# EasyEDA Pro project NAI-Redd PCB.epro

# Schematic Schematic2
Board Name: PCB2; Create Date: 2026-11-11; Page Name: P1; Project Name: NAI-Lucifer PCB; Schematic Name: Schematic2; Update Date: 2026-11-11; Company: EasyEDA.com; Page Size: A4; Version: V1.0
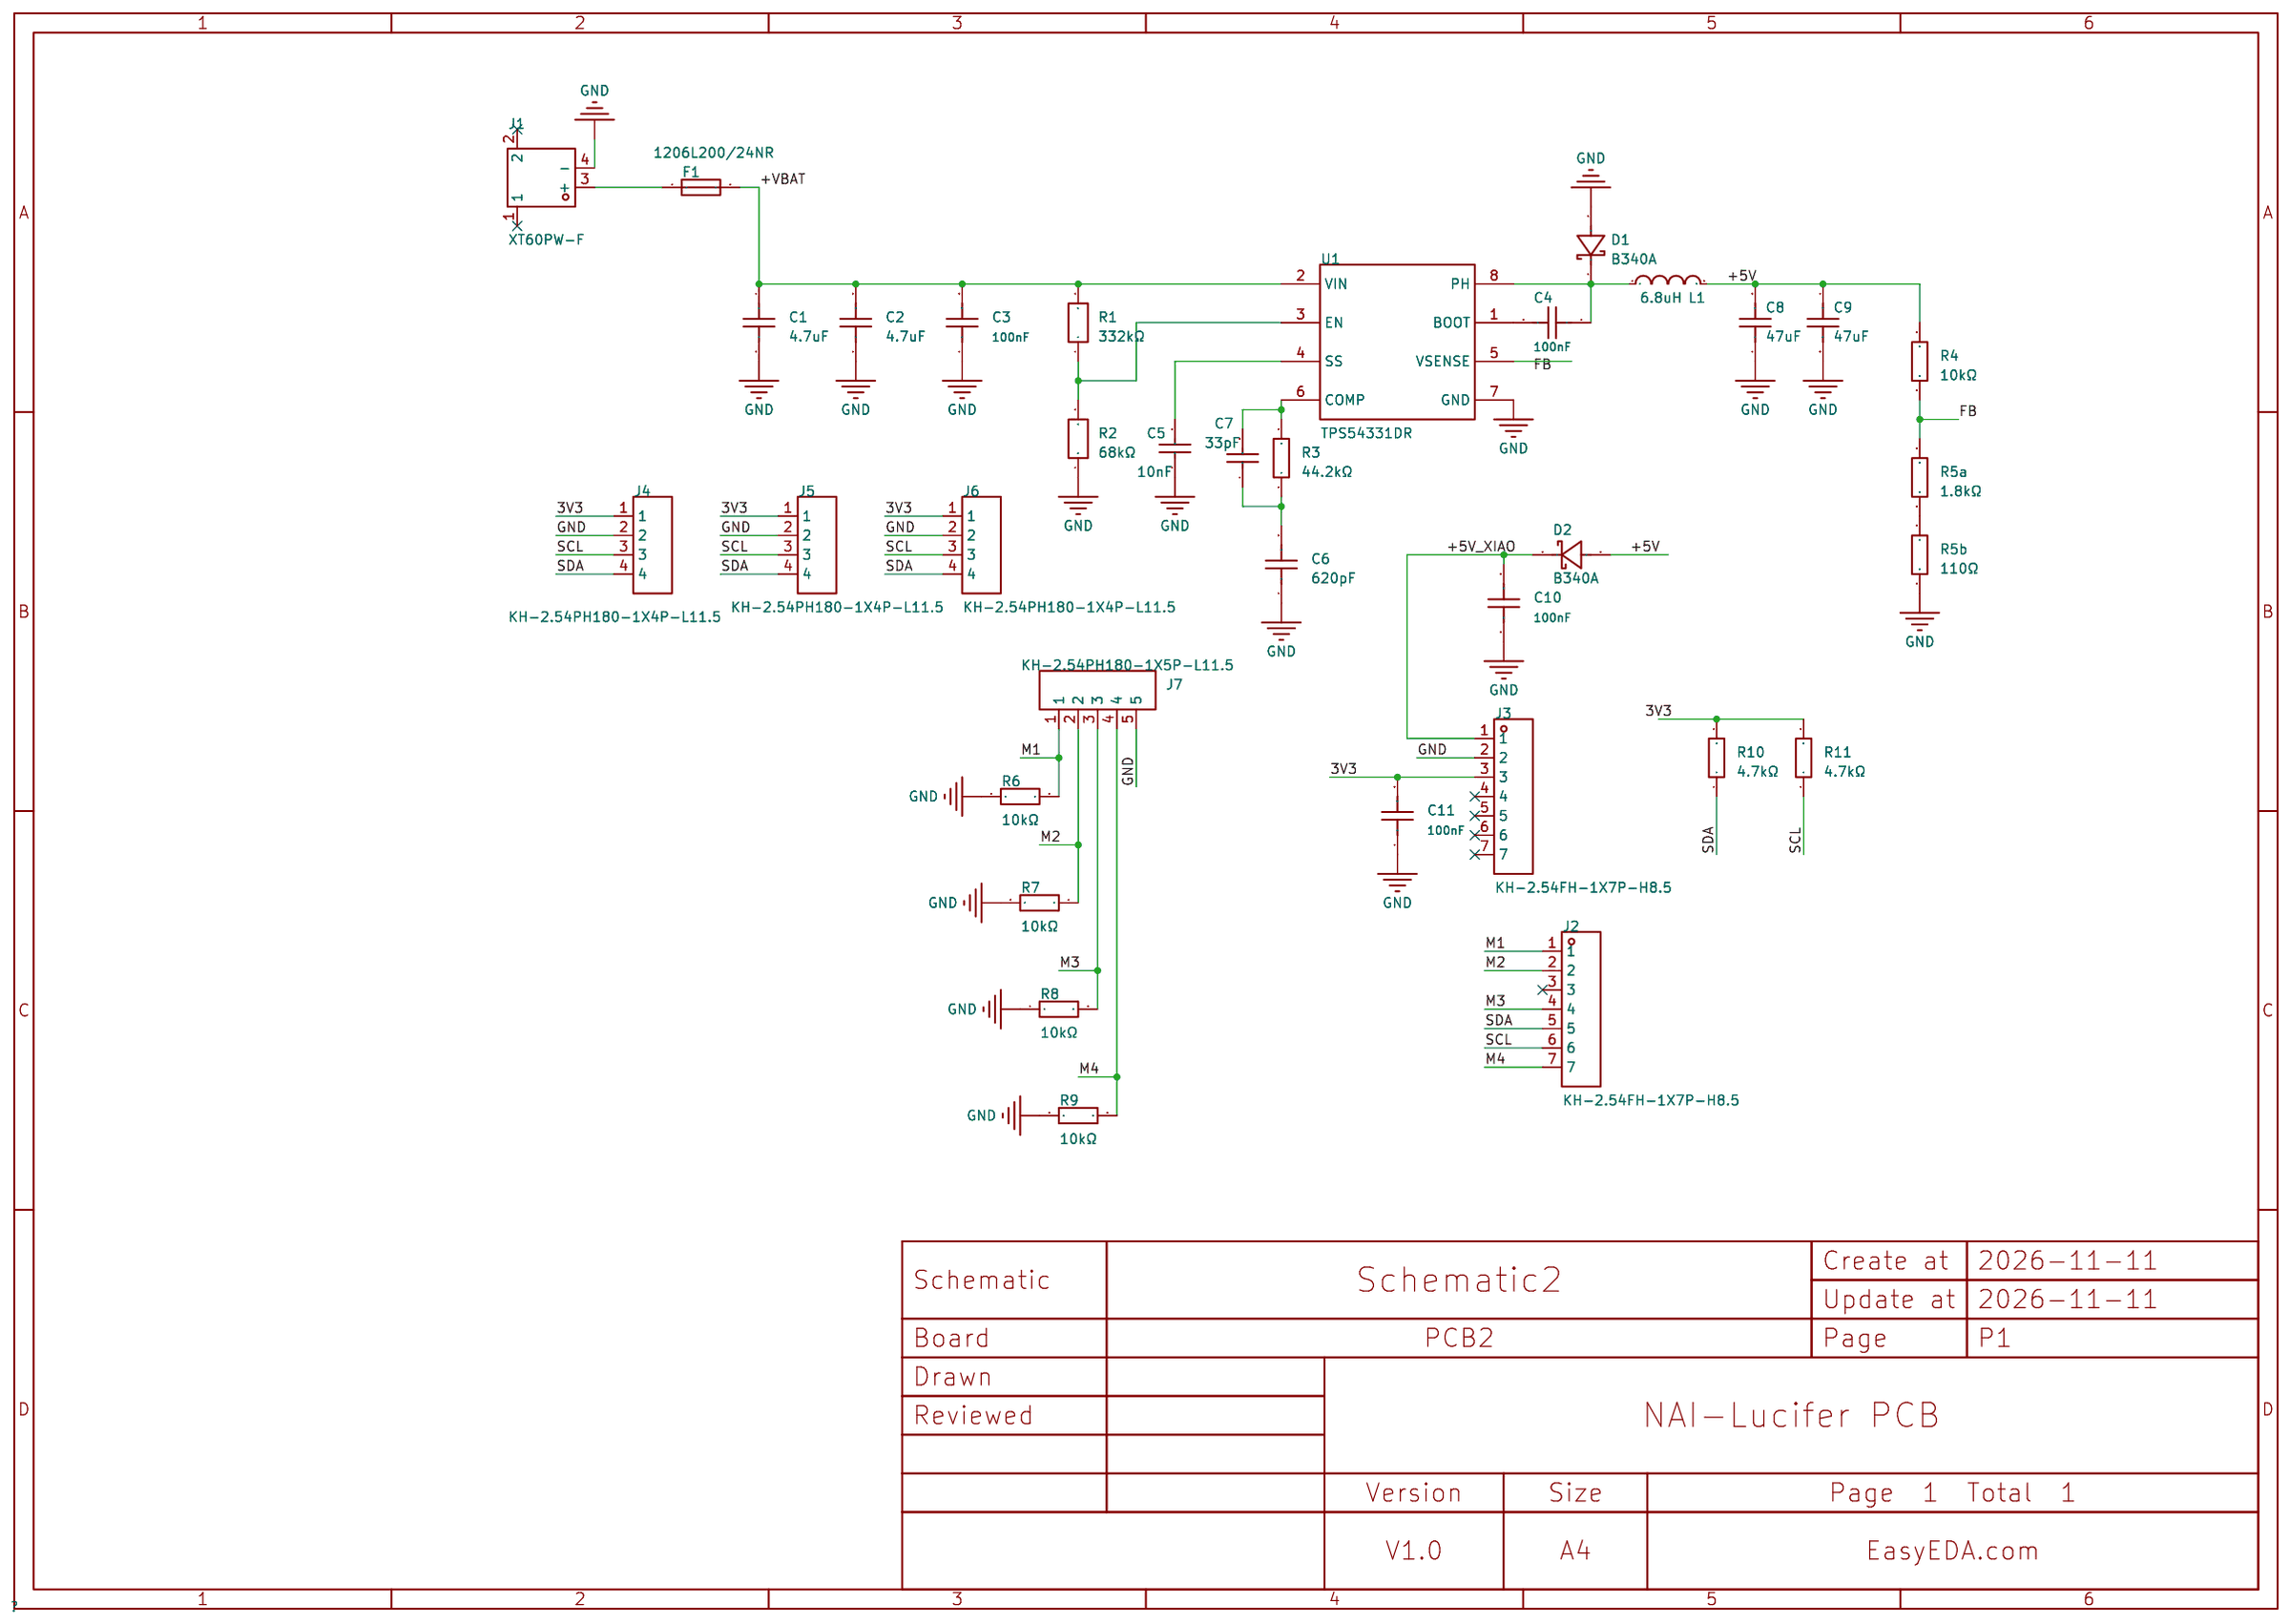
[diagram p0: schematic sheet]

## Parts
C1  4.7uF  [C1210]
C2  4.7uF  [C1210]
C3  100nF  [C0603]
C4  100nF  [C0603]
C5  10nF  [C0603]
C6  620pF  [C0603]
C7  33pF  [C0603]
C8  47uF  [C1206]
C9  47uF  [C1206]
C10  100nF  [C0603]
C11  100nF  [C0603]
D1  B340A  [SMA_L4.3-W2.6-LS5.0-RD]
D2  B340A  [SMA_L4.3-W2.6-LS5.0-RD]
F1  1206L200/24NR  [F1206]
J1  XT60PW-F  [TH_2P-XT60PW-F]
J2  KH-2.54FH-1X7P-H8.5  [HDR-TH_7P-P2.54-V-F]
J3  KH-2.54FH-1X7P-H8.5  [HDR-TH_7P-P2.54-V-F]
J4  KH-2.54PH180-1X4P-L11.5  [HDR-TH_4P-P2.54-V-M]
J5  KH-2.54PH180-1X4P-L11.5  [HDR-TH_4P-P2.54-V-M]
J6  KH-2.54PH180-1X4P-L11.5  [HDR-TH_4P-P2.54-V-M]
J7  KH-2.54PH180-1X5P-L11.5  [HDR-TH_5P-P2.54-V-M]
L1  6.8uH  [IND-SMD_L7.0-W6.6]
R1  332kΩ  [R0603]
R2  68kΩ  [R0603]
R3  44.2kΩ  [R0603]
R4  10kΩ  [R0603]
R5a  1.8kΩ  [R0603]
R5b  110Ω  [R0603]
R6  10kΩ  [R0603]
R7  10kΩ  [R0603]
R8  10kΩ  [R0603]
R9  10kΩ  [R0603]
R10  4.7kΩ  [R0603]
R11  4.7kΩ  [R0603]
U1  TPS54331DR  [SOIC-8_L5.0-W4.0-P1.27-LS6.0-BL]

## Library data of the parts
C1 C2 = C1210C475K5RACTU: Capacitance:4.7uF Tolerance:±10% Tolerance:±10% Voltage Rating:50V Temperature Coefficient:X7R; LCSC Part Name: 4.7uF ±10% 50V; Supplier Part: C2182224; Manufacturer: KEMET(基美); Supplier Footprint: 1210; JLCPCB Part Class: Extended Part; Datasheet: https://item.szlcsc.com/datasheet/C1210C475K5RACTU/2274291.html; Supplier: LCSC; Tolerance: ±10%; Voltage Rating: 50V; Temperature Coefficient: X7R; Check: true
C3 C4 C10 C11 = CC0603KRX7R9BB104: Capacitance:100nF Tolerance:±10% Tolerance:±10% Voltage Rating:50V Temperature Coefficient:X7R; LCSC Part Name: 100nF ±10% 50V; Supplier Part: C14663; Manufacturer: YAGEO(国巨); Supplier Footprint: 0603; JLCPCB Part Class: Basic Part; Datasheet: https://item.szlcsc.com/datasheet/CC0603KRX7R9BB104/15331.html; Supplier: LCSC; Tolerance: ±10%; Voltage Rating: 50V; Temperature Coefficient: X7R; Check: true
C5 = CL10B103KB8NNNC: Capacitance:10nF Tolerance:±10% Tolerance:±10% Voltage Rating:50V Temperature Coefficient:X7R; LCSC Part Name: 10nF ±10% 50V; Supplier Part: C1589; Manufacturer: SAMSUNG(三星); Supplier Footprint: 0603; JLCPCB Part Class: Extended Part; Datasheet: https://item.szlcsc.com/datasheet/CL10B103KB8NNNC/1941.html; Supplier: LCSC; Tolerance: ±10%; Voltage Rating: 50V; Temperature Coefficient: X7R; Check: true
C6 = GRM1885C1H621JA01D: Capacitance: Tolerance:±5% Tolerance:±5% Voltage Rated: Temperature Coefficient:; LCSC Part Name: 620pF ±5% 50V; Supplier Part: C527998; Manufacturer: muRata(村田); Supplier Footprint: 0603; JLCPCB Part Class: Extended Part; Datasheet: https://atta.szlcsc.com/upload/public/pdf/source/20200407/C503309_0211D99E6F86B2657E389DD3F8367252.pdf; Supplier: LCSC; Tolerance: ±5%; Check: true
C7 = CL10C330JB8NNNC: Capacitance:33pF Tolerance:±5% Tolerance:±5% Voltage Rating:50V Temperature Coefficient:C0G; LCSC Part Name: 33pF ±5% 50V; Supplier Part: C1663; Manufacturer: SAMSUNG(三星); Supplier Footprint: 0603; JLCPCB Part Class: Basic Part; Datasheet: https://item.szlcsc.com/datasheet/CL10C330JB8NNNC/2015.html; Supplier: LCSC; Tolerance: ±5%; Voltage Rating: 50V; Temperature Coefficient: C0G; Check: true
C8 C9 = CL31A476MPHNNNE: Capacitance:47uF Tolerance:±20% Tolerance:±20% Voltage Rating:10V Temperature Coefficient:X5R; LCSC Part Name: 47uF ±20% 10V; Supplier Part: C96123; Manufacturer: SAMSUNG(三星); Supplier Footprint: 1206; JLCPCB Part Class: Basic Part; Datasheet: https://item.szlcsc.com/datasheet/CL31A476MPHNNNE/97327.html; Supplier: LCSC; Tolerance: ±20%; Voltage Rating: 10V; Temperature Coefficient: X5R; Check: true
D1 D2 = B340A_C3018525: Forward Voltage (Vf@If):550mV@3A Reverse Voltage (Vr):40V Average Rectified Current (Io):3A Reverse Leakage Current (Ir):500uA@40V; LCSC Part Name: 电压:40V 电流:3A; Supplier Part: C3018525; Manufacturer: FUXINSEMI(富芯森美); Supplier Footprint: SMA(DO-214AC); JLCPCB Part Class: Extended Part; Datasheet: https://atta.szlcsc.com/upload/public/pdf/source/20220530/48889337C27311960E6F9D350CFD44EF.pdf; Supplier: LCSC; Forward Voltage (Vf@If): 550mV@3A; Reverse Voltage (Vr): 40V; Average Rectified Current (Io): 3A; Reverse Leakage Current (Ir): 500uA@40V; Check: true
F1 = 1206L200/24NR: Voltage - Max:24V Current - Max:40A Hold Current:2A Trip Current:3.5A Power Dissipation:1.2W Resistance - Initial (Ri) (Min):15mΩ Resistance - Post Trip (R1) (Max):80mΩ Time to Trip(Max):1.5s Operating Temperature:-40℃~+85℃ Operating Temperature:-40℃~+85℃; LCSC Part Name: 24V 2.00A 1206 自恢复; Supplier Part: C42396578; Manufacturer: LUTE(陆特); Supplier Footprint: 1206; JLCPCB Part Class: Extended Part; Datasheet: https://item.szlcsc.com/datasheet/1206L200%252F24NR/44344788.html; Supplier: LCSC; Voltage - Max: 24V; Current - Max: 40A; Hold Current: 2A; Trip Current: 3.5A; Power Dissipation: 1.2W; Resistance - Initial (Ri) (Min): 15mΩ; Resistance - Post Trip (R1) (Max): 80mΩ; Time to Trip(Max): 1.5s; Operating Temperature: -40℃~+85℃; Length: 3.6mm; Width: 1.9mm; Height: 1.6mm; Check: true
J1 = XT60PW-F: colour:Yellow Connector type:Horizontal plug interface form:Female; LCSC Part Name: AMASS(艾迈斯)插头锂电池组充电接头 线到板连接器大电流30A连接器 航模电调卧式焊板 母头XT60PW-F.G.Y; Supplier Part: C428722; Manufacturer: AMASS(艾迈斯); JLCPCB Part Class: Extended Part; Datasheet: https://item.szlcsc.com/datasheet/XT60PW-F/423834.html; Supplier: LCSC; colour: Yellow; Connector type: Horizontal plug; interface form: Female; Check: true
J2 J3 = KH-2.54FH-1X7P-H8.5: Holes Structure:1x7P Pitch:2.54mm Row Spacing:- Circular Hole / Square Hole:Square Hole Mounting Type:Through Hole Number of Rows:1 Number of Positions:7P Current Rating:3A Voltage Rating (Max):- Holes Direction:Top Insulation Height:8.5mm Contact Materia; LCSC Part Name: 1x7P 间距:2.54mm 直插; Supplier Part: C2932672; Manufacturer: kinghelm(金航标); Supplier Footprint: 插件,P=2.54mm; JLCPCB Part Class: Extended Part; Datasheet: https://item.szlcsc.com/datasheet/KH-2.54FH-1X7P-H8.5/3278193.html; Supplier: LCSC; Holes Structure: 1x7P; Pitch: 2.54mm; Circular Hole / Square Hole: Square Hole; Mounting Type: Through Hole; Number of Rows: 1; Number of Positions: 7P; Current Rating: 3A; Holes Direction: Top; Insulation Height: 8.5mm; Contact Material: Brass; Contact Plating: Gold; Operating Temperature: -40℃~+105℃; PIN Length: 3mm; Check: true
J4-J6 = KH-2.54PH180-1X4P-L11.5: Pin Structure:1x4P Pitch:2.54mm Row Spacing:- Circluar Pins/Square Pins:Pin Header Mounting Type:Through Hole Number of Rows:1 Number of Pins:4P Current Rating:3A Voltage Rating (Max):- Length of Mating Pin:6mm Insulation Height:2.5mm Length of End Connec; LCSC Part Name: 1x4P 间距:2.54mm 方针 直插; Supplier Part: C2905435; Manufacturer: kinghelm(金航标); Supplier Footprint: 插件,P=2.54mm; JLCPCB Part Class: Extended Part; Datasheet: https://item.szlcsc.com/datasheet/KH-2.54PH180-1X4P-L11.5/3175223.html; Supplier: LCSC; Pin Structure: 1x4P; Pitch: 2.54mm; Circluar Pins/Square Pins: Pin Header; Mounting Type: Through Hole; Number of Rows: 1; Number of Pins: 4P; Current Rating: 3A; Length of Mating Pin: 6mm; Insulation Height: 2.5mm; Length of End Connection Pin: 3mm; Operating Temperature: -40℃~+105℃; Color: Black; Check: true
J7 = KH-2.54PH180-1X5P-L11.5: Pin Structure:1x5P Pitch:2.54mm Row Spacing:- Circluar Pins/Square Pins:Pin Header Mounting Type:Through Hole Number of Rows:1 Number of Pins:5P Current Rating:3A Voltage Rating (Max):- Length of Mating Pin:6mm Insulation Height:2.5mm Length of End Connec; LCSC Part Name: 1x5P 间距:2.54mm 方针 直插; Supplier Part: C2932699; Manufacturer: kinghelm(金航标); Supplier Footprint: 插件,P=2.54mm; JLCPCB Part Class: Extended Part; Datasheet: https://item.szlcsc.com/datasheet/KH-2.54PH180-1X5P-L11.5/3278220.html; Supplier: LCSC; Pin Structure: 1x5P; Pitch: 2.54mm; Circluar Pins/Square Pins: Pin Header; Mounting Type: Through Hole; Number of Rows: 1; Number of Pins: 5P; Current Rating: 3A; Length of Mating Pin: 6mm; Insulation Height: 2.5mm; Length of End Connection Pin: 3mm; Operating Temperature: -40℃~+105℃; Color: Black; Check: true
L1 = TMPC0624H-6R8MG-D: Inductance: Tolerance:±20% Tolerance:±20% Rated Current: Saturation Current (Isat):7A DC Resistance (DCR):; LCSC Part Name: 6.8uH ±20% 7A; Supplier Part: C357230; Manufacturer: TAI-TECH(台庆); Supplier Footprint: SMD,7x6.6mm; JLCPCB Part Class: Extended Part; Datasheet: https://atta.szlcsc.com/upload/public/pdf/source/20200917/C357230_D0E636AD8F4F6E55E8FC0BE9190F699A.pdf; Supplier: LCSC; Tolerance: ±20%; Saturation Current (Isat): 7A; Check: true
R1 = RMCF0603FT332K: Type:Thick Film Resistor Resistance:332kΩ Tolerance:±1% Tolerance:±1% Power(Watts):100mW Temperature Coefficient:±100ppm/℃ Temperature Coefficient:±100ppm/℃ Operating Temperature:-55℃~+155℃ Operating Temperature:-55℃~+155℃; LCSC Part Name: 厚膜电阻 332kΩ ±1% 100mW; Supplier Part: C3994408; Manufacturer: SEI(Stackpole Electronics Inc.); Supplier Footprint: 0603; JLCPCB Part Class: Extended Part; Datasheet: https://item.szlcsc.com/datasheet/RMCF0603FT332K/4563600.html; Supplier: LCSC; Type: Thick Film Resistor; Tolerance: ±1%; Power(Watts): 100mW; Temperature Coefficient: ±100ppm/℃; Operating Temperature: -55℃~+155℃; Check: true
R2 = FRC0603F6802TS: Type:Thick Film Resistor Resistance:68kΩ Tolerance:±1% Tolerance:±1% Power(Watts):100mW Voltage-Supply(Max):75V Temperature Coefficient:±100ppm/℃ Temperature Coefficient:±100ppm/℃ Operating Temperature:-55℃~+155℃ Operating Temperature:-55℃~+155℃; LCSC Part Name: 68kΩ ±1% 100mW 厚膜电阻; Supplier Part: C2907063; Manufacturer: FOJAN(富捷); Supplier Footprint: 0603; JLCPCB Part Class: Extended Part; Supplier: LCSC; Type: Thick Film Resistor; Tolerance: ±1%; Power(Watts): 100mW; Voltage-Supply(Max): 75V; Temperature Coefficient: ±100ppm/℃; Operating Temperature: -55℃~+155℃; Check: true
R3 = RK73H1JTTD4422F: Type:Thick Film Resistor Resistance:44.2kΩ Tolerance:±1% Tolerance:±1% Power(Watts):100mW Voltage-Supply(Max):75V Temperature Coefficient:±100ppm/℃ Temperature Coefficient:±100ppm/℃ Operating Temperature:-55℃~+155℃ Operating Temperature:-55℃~+155℃; LCSC Part Name: 厚膜电阻 44.2kΩ ±1% 100mW; Supplier Part: C317170; Manufacturer: KOA; Supplier Footprint: 0603; JLCPCB Part Class: Extended Part; Datasheet: https://item.szlcsc.com/datasheet/RK73H1JTTD4422F/298752.html; Supplier: LCSC; Type: Thick Film Resistor; Tolerance: ±1%; Power(Watts): 100mW; Voltage-Supply(Max): 75V; Temperature Coefficient: ±100ppm/℃; Operating Temperature: -55℃~+155℃; Check: true
R4 R6-R9 = 0603WAF1002T5E: Type:Thick Film Resistor Resistance:10kΩ Tolerance:±1% Tolerance:±1% Power(Watts):100mW Voltage-Supply(Max):75V Temperature Coefficient:±100ppm/℃ Temperature Coefficient:±100ppm/℃ Operating Temperature:-55℃~+155℃ Operating Temperature:-55℃~+155℃; LCSC Part Name: 厚膜电阻 10kΩ ±1% 100mW; Supplier Part: C25804; Manufacturer: UNI-ROYAL(厚声); Supplier Footprint: 0603; JLCPCB Part Class: Basic Part; Datasheet: https://item.szlcsc.com/datasheet/0603WAF1002T5E/26547.html; Supplier: LCSC; Type: Thick Film Resistor; Tolerance: ±1%; Power(Watts): 100mW; Voltage-Supply(Max): 75V; Temperature Coefficient: ±100ppm/℃; Operating Temperature: -55℃~+155℃; Check: true
R5a = 0603WAF1801T5E: Type:Thick Film Resistor Resistance:1.8kΩ Tolerance:±1% Tolerance:±1% Power(Watts):100mW Voltage-Supply(Max):75V Temperature Coefficient:±100ppm/℃ Temperature Coefficient:±100ppm/℃ Operating Temperature:-55℃~+155℃ Operating Temperature:-55℃~+155℃; LCSC Part Name: 厚膜电阻 1.8kΩ ±1%; Supplier Part: C4177; Manufacturer: UNI-ROYAL(厚声); Supplier Footprint: 0603; JLCPCB Part Class: Basic Part; Datasheet: https://item.szlcsc.com/datasheet/0603WAF1801T5E/4584.html; Supplier: LCSC; Type: Thick Film Resistor; Tolerance: ±1%; Power(Watts): 100mW; Voltage-Supply(Max): 75V; Temperature Coefficient: ±100ppm/℃; Operating Temperature: -55℃~+155℃; Check: true
R5b = HPCR0603F110RK9: Type:Thick Film Resistor Resistance:110Ω Tolerance:±1% Tolerance:±1% Power(Watts):125mW Voltage-Supply(Max):50V Temperature Coefficient:±100ppm/℃ Temperature Coefficient:±100ppm/℃ Operating Temperature:-55℃~+125℃ Operating Temperature:-55℃~+125℃; LCSC Part Name: 厚膜电阻 110Ω ±1% 125mW; Supplier Part: C365068; Manufacturer: RESI(开步睿思); Supplier Footprint: 0603; JLCPCB Part Class: Extended Part; Datasheet: https://item.szlcsc.com/datasheet/HPCR0603F110RK9/339284.html; Supplier: LCSC; Type: Thick Film Resistor; Tolerance: ±1%; Power(Watts): 125mW; Voltage-Supply(Max): 50V; Temperature Coefficient: ±100ppm/℃; Operating Temperature: -55℃~+125℃; Check: true
R10 R11 = 0603WAF4701T5E: Type:Thick Film Resistor Resistance:4.7kΩ Tolerance:±1% Tolerance:±1% Power(Watts):100mW Voltage-Supply(Max):75V Temperature Coefficient:±100ppm/℃ Temperature Coefficient:±100ppm/℃ Operating Temperature:-55℃~+155℃ Operating Temperature:-55℃~+155℃; LCSC Part Name: 厚膜电阻 4.7kΩ ±1%; Supplier Part: C23162; Manufacturer: UNI-ROYAL(厚声); Supplier Footprint: 0603; JLCPCB Part Class: Basic Part; Datasheet: https://item.szlcsc.com/datasheet/0603WAF4701T5E/23889.html; Supplier: LCSC; Type: Thick Film Resistor; Tolerance: ±1%; Power(Watts): 100mW; Voltage-Supply(Max): 75V; Temperature Coefficient: ±100ppm/℃; Operating Temperature: -55℃~+155℃; Check: true
U1 = TPS54331DR: Function:Step-down type Voltage - Supply:3.5V~28V Voltage - Supply:3.5V~28V Output Voltage:800mV~25V Output Voltage:800mV~25V Output Current:3A Frequency - Switching:570kHz Frequency - Switching:570kHz Operating Temperature:-40℃~+150℃@(TJ) Operating Tempe; LCSC Part Name: 降压型 3A 3.5V~28V; Supplier Part: C9865; Manufacturer: TI(德州仪器); Supplier Footprint: SOIC-8; JLCPCB Part Class: Extended Part; Datasheet: https://www.ti.com/cn/lit/ds/symlink/tps54331.pdf; Supplier: LCSC; Function: Step-down type; Voltage - Supply: 3.5V~28V; Output Voltage: 800mV~25V; Output Current: 3A; Frequency - Switching: 570kHz; Operating Temperature: -40℃~+150℃@(TJ); Synchronous Rectifier: No; Number of Outputs: 1; Topology: Buck; Quiescent Current: 110uA; Switch tube (built-in/external): Built-in; Output Type: Adjustable; Features: Light load efficient mode；External compensation；Cycle-by-cycle current limiting；Adjustable soft-start；Overcurrent Protection; Check: true

## Nets
3V3: C11.2 J3.3 J4.1 J5.1 J6.1 R10.2 R11.2
+5V: C8.2 C9.1 D2.2(A) L1.2 R4.2
+5V_XIAO: C10.2 D2.1(K) J3.1
+VBAT: C1.1 C2.2 C3.2 F1.2 R1.2 U1.2(VIN)
GND: C1.2 C2.1 C3.1 C5.1 C6.1 C8.1 C9.2 C10.1 C11.1 D1.2(A) J1.4(-) J3.2 J4.2 J5.2 J6.2 J7.5 R2.1 R5b.1 R6.1 R7.2 R8.1 R9.1 U1.7(GND)
FB: R4.1 R5a.2 U1.5(VSENSE)
M1: J2.1 J7.1 R6.2
M2: J2.2 J7.2 R7.1
M3: J2.4 J7.3 R8.2
M4: J2.7 J7.4 R9.2
SCL: J2.6 J4.3 J5.3 J6.3 R11.1
SDA: J2.5 J4.4 J5.4 J6.4 R10.1
$1N9: C4.1 D1.1(K) L1.1 U1.8(PH)
$1N10: C7.2 R3.2 U1.6(COMP)
$1N12: C6.2 C7.1 R3.1
$1N21: F1.1 J1.3(+)
$1N27: R1.1 R2.2 U1.3(EN)
$1N28: C5.2 U1.4(SS)
$1N30: R5a.1 R5b.2
$1N73: C4.2 U1.1(BOOT)

Not connected (* = marked no-connect by the designer): J1 1* 2*; J2 3*; J3 4* 5* 6* 7*

# Board PCB2
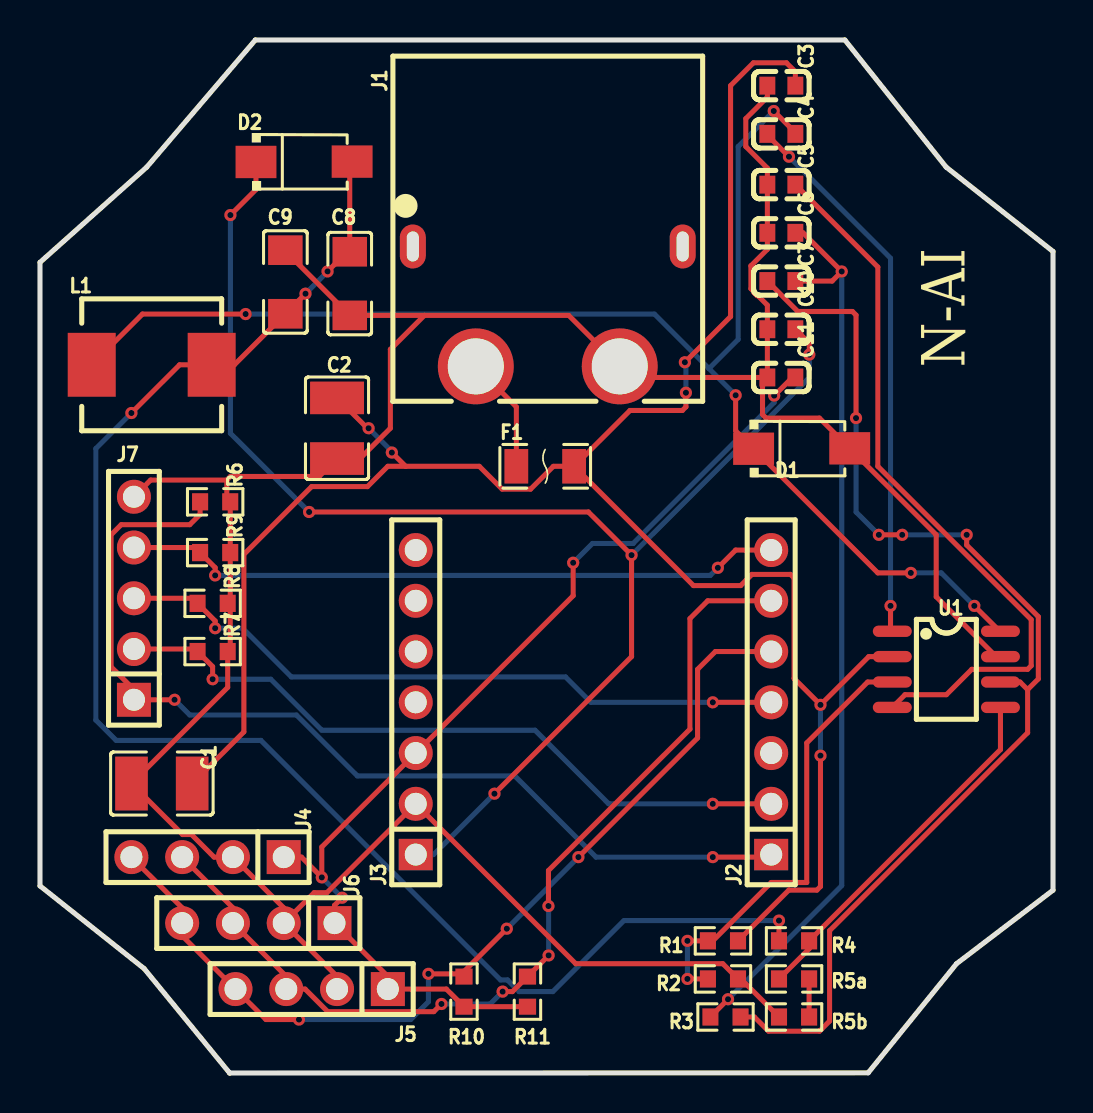
[diagram p1: board, top side]
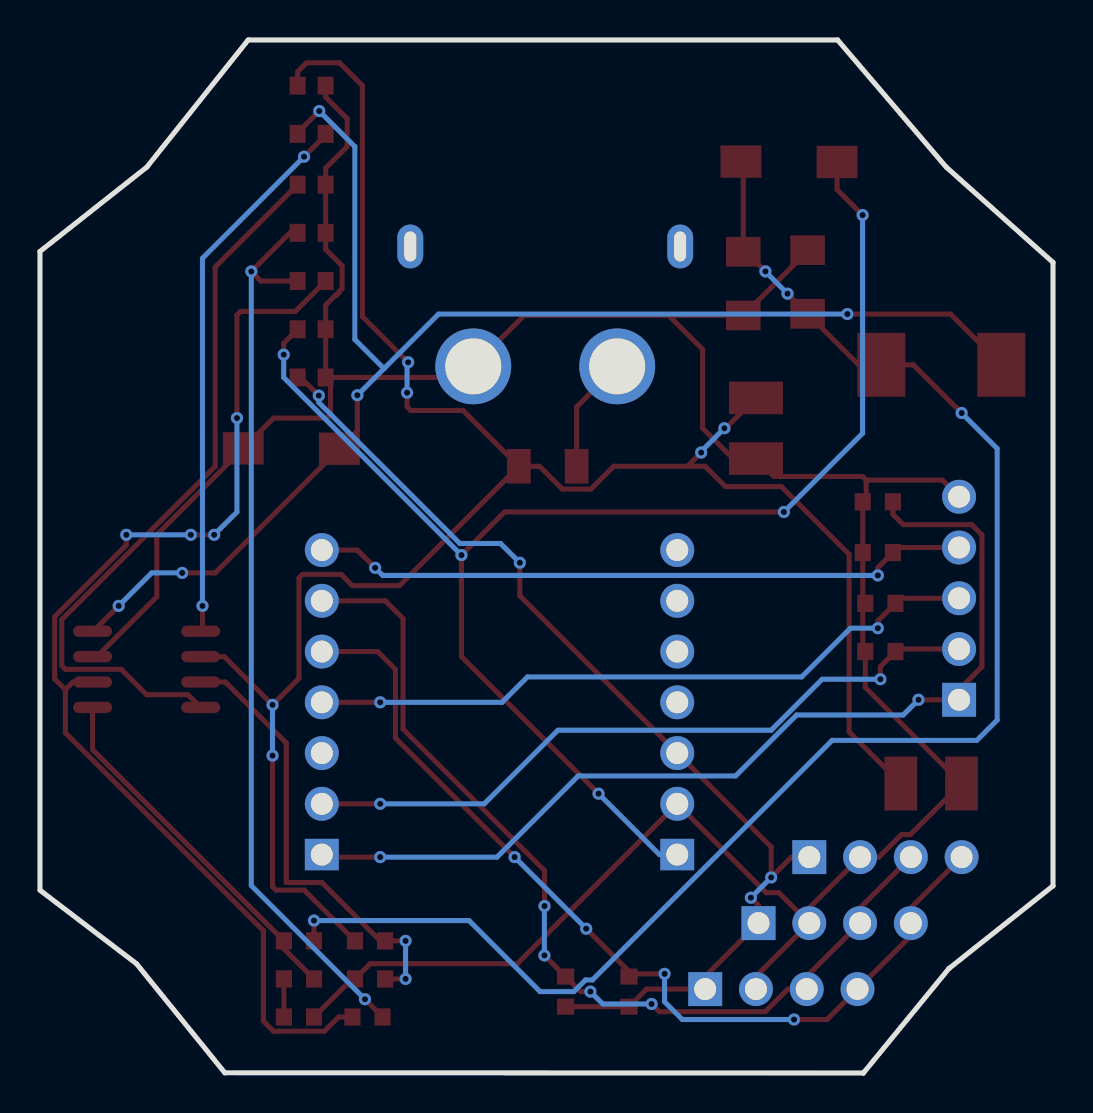
[diagram p2: board, bottom side, seen from below]

Outline 50.67 x 51.7 mm; copper layers: Top Layer, Bottom Layer. Coordinates in mm from the lower left corner of the outline.
Outline path: 0,40.57 5.34,45.34 10.77,51.7 40.26,51.7 45.33,45.34 50.67,41.11 50.67,9.15 45.85,5.47 41.43,0.01 9.49,0 9.49,0 5.21,5.22 0,9.37 0,40.57
Stack: Top Layer 0.035mm / Dielectric1 1.51mm FR4 er 4.5 / Bottom Layer 0.035mm

## Design rules (mm)
spacing copperThickness1oz (default): track to track 0.102, other pairs 0.152 to 0.3
spacing copperThickness2oz: track to track 0.203, other pairs 0.152 to 0.3
track width copperThickness1oz (default): min 0.127, default 0.254, max 2.54
track width copperThickness2oz: min 0.203, default 0.254, max 2.54
differential pair differentialPair (default): width min 0.127, default 0.254, max 2.54; gap min 0.152, default 0.152

## Placement (name value [footprint] x y rotation side)
C1  4.7uF  [C1210]  6.1 14.49 180 top
C2  4.7uF  [C1210]  14.86 32.27 90 top
C3  100nF  [C0603]  37.08 49.41 0 top
C4  100nF  [C0603]  37.08 47 180 top
C5  10nF  [C0603]  37.08 44.46 0 top
C6  620pF  [C0603]  37.08 42.05 0 top
C7  33pF  [C0603]  37.08 39.63 180 top
C8  47uF  [C1206]  15.49 39.51 90 top
C9  47uF  [C1206]  12.28 39.59 90 top
C10  100nF  [C0603]  37.08 37.22 0 top
C11  100nF  [C0603]  37.08 34.81 0 top
D1  B340A  [SMA_L4.3-W2.6-LS5.0-RD]  38.1 31.25 0 top
D2  B340A  [SMA_L4.3-W2.6-LS5.0-RD]  13.21 45.6 0 top
F1  1206L200/24NR  [F1206]  25.27 30.36 0 top
J1  XT60PW-F  [TH_2P-XT60PW-F]  25.4 38.36 0 top
J2  KH-2.54FH-1X7P-H8.5  [HDR-TH_7P-P2.54-V-F]  36.58 18.55 90 top
J3  KH-2.54FH-1X7P-H8.5  [HDR-TH_7P-P2.54-V-F]  18.8 18.55 90 top
J4  KH-2.54PH180-1X4P-L11.5  [HDR-TH_4P-P2.54-V-M]  8.38 10.81 180 top
J5  KH-2.54PH180-1X4P-L11.5  [HDR-TH_4P-P2.54-V-M]  13.59 4.2 180 top
J6  KH-2.54PH180-1X4P-L11.5  [HDR-TH_4P-P2.54-V-M]  10.92 7.5 180 top
J7  KH-2.54PH180-1X5P-L11.5  [HDR-TH_5P-P2.54-V-M]  4.7 23.76 90 top
L1  6.8uH  [IND-SMD_L7.0-W6.6]  5.59 35.44 0 top
R1  332kΩ  [R0603]  34.16 6.61 0 top
R2  68kΩ  [R0603]  34.16 4.71 180 top
R3  44.2kΩ  [R0603]  34.29 2.8 0 top
R4  10kΩ  [R0603]  37.72 6.61 180 top
R5a  1.8kΩ  [R0603]  37.72 4.71 180 top
R5b  110Ω  [R0603]  37.72 2.8 0 top
R6  10kΩ  [R0603]  8.76 28.59 180 top
R7  10kΩ  [R0603]  8.64 21.09 0 top
R8  10kΩ  [R0603]  8.64 23.51 180 top
R9  10kΩ  [R0603]  8.76 26.05 180 top
R10  4.7kΩ  [R0603]  21.21 4.07 270 top
R11  4.7kΩ  [R0603]  24.38 4.07 270 top
U1  TPS54331DR  [SOIC-8_L5.0-W4.0-P1.27-LS6.0-BL]  45.34 20.2 270 top

## Footprints (pads in the part's own frame, mm; a bottom-side part is the same pattern mirrored in y, then rotated)
C0603
  rect 0.8x0.9 smd: 1(-0.7,0) 2(0.7,0)
C1206
  rect 1.485x1.728 smd: 1(-1.593,0) 2(1.593,0)
C1210
  rect 1.635x2.7 smd: 1(-1.518,0) 2(1.518,0)
F1206
  rect 1.19x1.728 smd: 1(-1.445,0) 2(1.445,0)
HDR-TH_4P-P2.54-V-M
  rect 1.7x1.7 hole 1.1: 1(-3.81,0)
  round 1.7 hole 1.1: 2(-1.27,0) 3(1.27,0) 4(3.81,0)
HDR-TH_5P-P2.54-V-M
  rect 1.7x1.7 hole 1.1: 1(-5.08,0)
  round 1.7 hole 1.1: 2(-2.54,0) 3(0,0) 4(2.54,0) 5(5.08,0)
HDR-TH_7P-P2.54-V-F
  rect 1.575x1.7 hole 1.1: 1(-7.62,0)
  round 1.7 hole 1.1: 2(-5.08,0) 3(-2.54,0) 4(0,0) 5(2.54,0) 6(5.08,0) 7(7.62,0)
IND-SMD_L7.0-W6.6
  rect 2.4x3.2 smd: 1(-3,0) 2(3,0)
R0603
  rect 0.806x0.864 smd: 1(-0.753,0) 2(0.753,0)
SMA_L4.3-W2.6-LS5.0-RD
  rect 2.046x1.62 smd: 1(-2.404,-0.009) 2(2.404,0.009)
SOIC-8_L5.0-W4.0-P1.27-LS6.0-BL
  oval 0.569x1.95 smd: 1(-1.905,-2.705) 2(-0.635,-2.705) 3(0.635,-2.705) 4(1.905,-2.705) 5(1.905,2.705) 6(0.635,2.705) 7(-0.635,2.705) 8(-1.905,2.705)
TH_2P-XT60PW-F
  oval 1.3x2.2 hole 0.6x1.5: 1(-6.75,3) 2(6.75,3)
  round 3.8 hole 2.8: 3(-3.6,-3) 4(3.6,-3)

## Nets
As in the schematic.

Pads without a net: J1 1 2; J2 3; J3 4 5 6 7

## Via types
v1: diameter 0.61, hole 0.305, Top Layer to Bottom Layer, 50 vias

## Routing (per net, layer and track width the routed paths; a pad name or vN(x,y) marks a point on that pad's centre or on a via; arc(x,y) is an arc through that point)
3V3: length 53.1
  Top Layer w0.254: v1(36.73,33.9) 37.63,34.81 C11.2 ; J4.1 13.08,10.81 v1(14.1,9.79) 14.1,11.31 J3.3 26.67,23.89 v1(26.67,25.54) ; R11.2 R10.2 20.33,4.2 J5.1 17.4,4.84 J6.1 14.73,8.39 v1(15.11,8.77)
  Bottom Layer w0.254: v1(15.11,8.77) v1(14.1,9.79) ; v1(26.67,25.54) 27.63,26.5 29.67,26.5 36.73,33.56 v1(36.73,33.9)
+5V: length 77.2
  Top Layer w0.254: D2.2 15.49,45.49 C8.2 15.37,41.1 v1(14.38,40.12) ; R4.2 v1(36.97,7.63) ; v1(4.57,33.03) 6.98,35.44 L1.2 9.72,35.44 C9.1 v1(13.28,39)
  Bottom Layer w0.254: v1(36.97,7.63) 29.21,7.63 25.65,4.07 23.97,4.07 23.38,4.66 23.04,4.66 11.05,16.65 3.81,16.65 2.79,17.66 2.79,31.25 v1(4.57,33.03) ; v1(13.28,39) 14.38,40.1 v1(14.38,40.12)
+5V_XIAO: length 72
  Top Layer w0.254: D2.1 10.8,44.22 v1(9.53,42.94) ; v1(22.73,13.98) 29.59,20.84 v1(29.59,25.92) 27.43,28.08 v1(13.46,28.08) ; C10.2 38.48,36.52 v1(38.48,35.95)
  Bottom Layer w0.254: v1(22.73,13.98) 19.69,10.93 J3.1 ; v1(13.46,28.08) 9.53,32.01 v1(9.53,42.94) ; v1(29.59,25.92) 38.48,34.81 v1(38.48,35.95)
+VBAT: length 104.7
  Top Layer w0.254: C2.2 16.39,32.26 ; 18.29,30.36 17.4,30.36 16.38,29.35 13.59,29.35 10.2,25.96 10.2,17.07 C1.1 ; 18.29,30.36 21.97,30.36 23.12,29.22 24.54,29.22 25.68,30.36 F1.2 ; 18.29,30.36 v1(17.6,31.05) ; R1.2 37.46,9.15 38.86,9.15 39.04,9.33 v1(39.04,15.89) ; U1.2 41.45,20.84 v1(39.04,18.43) 37.72,19.75 37.72,24.78 37.54,24.95 35.61,24.95 35.05,24.39 32.69,24.39 F1.2 ; v1(32.26,35.57) 34.54,37.86 34.54,49.41 35.69,50.56 37.34,50.56 37.78,50.11 C3.2 ; v1(32.31,34.05) 32.31,33.34 32.13,33.16 29.51,33.16 F1.2
  Bottom Layer w0.254: v1(39.04,15.89) v1(39.04,18.43) ; v1(17.6,31.05) 17.6,31.11 v1(16.44,32.27) ; v1(32.31,34.05) 32.31,35.52 v1(32.26,35.57)
GND: length 148.6
  Top Layer w0.254: R5b.1 35.06,4.71 R2.1 34.15,5.47 26.8,5.47 J3.2 14.35,9.03 13.72,9.03 J6.2 ; 9.35,29.68 9.35,28.76 R6.1 R9.1 9.52,21.22 R7.2 9.39,19.3 C1.2 7.13,11.93 7.58,11.93 8.71,10.81 J4.2 12.19,8.27 J6.2 ; 9.35,29.68 9.53,29.86 13.96,29.86 C2.1 16.01,30.75 17.53,32.27 17.53,36.21 19.23,37.91 ; 9.35,29.68 5.54,29.68 J7.5 ; J6.2 14.86,4.84 J5.2 ; C11.1 29.56,34.81 J1.4 26.45,37.91 19.23,37.91 ; C11.1 36.14,34.57 36.14,32.96 36.32,32.78 38.99,32.78 D1.2 44.83,26.93 44.83,23.83 47.83,20.84 U1.7 ; C11.1 C10.1 36.38,38.43 35.91,38.91 35.87,38.91 35.7,39.07 35.7,39.11 35.56,39.25 35.56,40.4 36.38,41.22 C6.1 C5.1 36.38,45.29 35.31,46.37 35.31,47.76 36.38,48.84 C3.1 ; 19.23,37.91 C8.1 12.28,41.13 C9.2
FB: length 18.2
  Top Layer w0.254: R5a.2 38.47,6.22 R4.1 48.04,16.19 U1.5
M1: length 49.4
  Top Layer w0.254: J2.1 36.45,10.81 v1(33.66,10.81) ; R6.2 8.01,27.96 7.49,27.44 4.06,27.44 3.56,26.93 3.56,20.33 4.7,19.19 J7.1 v1(6.73,18.68)
  Bottom Layer w0.254: v1(33.66,10.81) 27.81,10.81 23.75,14.87 15.88,14.87 12.83,17.92 7.49,17.92 v1(6.73,18.68)
M2: length 35.5
  Top Layer w0.254: v1(33.66,13.47) J2.2 ; v1(8.64,19.71) 8.64,20.34 R7.1 7.76,21.22 J7.2
  Bottom Layer w0.254: v1(8.64,19.71) 11.54,19.71 14.1,17.16 24.76,17.16 28.45,13.47 v1(33.66,13.47)
M3: length 34.2
  Top Layer w0.254: v1(33.66,18.55) J2.4 ; v1(8.76,22.26) 8.76,22.62 R8.2 7.63,23.76 J7.3
  Bottom Layer w0.254: v1(33.66,18.55) 27.56,18.55 26.29,19.82 12.57,19.82 10.13,22.26 v1(8.76,22.26)
M4: length 33.2
  Top Layer w0.254: J7.4 7.76,26.3 R9.2 8.76,25.29 v1(8.76,24.9) ; J2.7 34.8,26.17 v1(33.91,25.28)
  Bottom Layer w0.254: v1(8.76,24.9) 33.53,24.9 v1(33.91,25.28)
SCL: length 47.7
  Top Layer w0.254: J2.6 33.4,23.63 32.51,22.74 32.51,17.21 25.44,10.13 v1(25.44,8.36) ; v1(25.44,5.89) R11.1 23.63,4.07 v1(23.14,4.07) ; v1(20.08,3.46) 19.7,3.07 14.39,3.07 13.26,4.2 J5.3 12.32,4.84 J6.3 9.65,8.27 J4.3
  Bottom Layer w0.254: v1(20.08,3.46) 22.52,3.46 v1(23.14,4.07) ; v1(25.44,8.36) 25.44,8.35 v1(25.44,5.89)
SDA: length 46.9
  Top Layer w0.254: J2.5 33.78,21.09 32.89,20.2 32.89,16.77 v1(26.93,10.81) ; v1(19.43,4.96) 21.07,4.96 R10.1 21.21,5.08 v1(23.35,7.22) ; v1(12.95,2.68) 11.3,2.68 J5.4 7.11,6.87 J6.4 7.11,8.27 J4.4
  Bottom Layer w0.254: v1(23.35,7.22) v1(26.93,10.81) ; v1(19.43,4.96) 19.43,3.57 18.54,2.68 v1(12.95,2.68)
$1N9: length 69.9
  Top Layer w0.254: v1(46.74,23.38) 48.01,22.11 U1.8 ; v1(43.56,25.03) 41.91,25.03 D1.1 34.8,32.14 v1(34.8,33.92) ; C4.1 37.78,47.06 v1(36.7,48.14) ; L1.1 5.13,37.98 v1(10.29,37.98)
  Bottom Layer w0.254: 33.46,35.25 30.73,37.98 v1(10.29,37.98) ; 33.46,35.25 34.92,36.71 34.92,46.37 v1(36.7,48.14) ; 33.46,35.25 v1(34.8,33.92) ; v1(43.56,25.03) 45.08,25.03 v1(46.74,23.38)
$1N10: length 57.6
  Top Layer w0.254: R3.2 35.74,2.8 36.45,2.09 38.99,2.09 39.5,2.6 39.5,7.12 49.4,17.03 49.4,19.19 ; 49.4,19.19 49.02,19.57 U1.6 ; 49.4,19.19 49.94,19.72 49.94,22.84 46.35,26.42 v1(46.35,26.93) ; C7.2 37.91,38.11 40.64,38.11 40.82,37.93 v1(40.82,32.78) ; v1(43.13,26.93) v1(41.96,26.93)
  Bottom Layer w0.254: v1(41.96,26.93) 40.82,28.08 v1(40.82,32.78) ; v1(46.35,26.93) v1(43.13,26.93)
$1N12: length 45.7
  Top Layer w0.254: C6.2 38.17,42.05 v1(40.1,40.11) 39.62,39.63 C7.1 ; R3.1 33.54,2.81 v1(34.42,3.69)
  Bottom Layer w0.254: v1(40.1,40.11) 40.1,9.38 v1(34.42,3.69)
$1N21: length 5.8
  Top Layer w0.254: F1.1 23.83,33.34 J1.3
$1N27: length 22.6
  Top Layer w0.254: v1(32.38,4.71) R2.2 ; v1(32.38,6.61) R1.1 33.66,6.61 36.58,9.54 38.35,9.54 38.35,16.52 41.4,19.57 U1.3
  Bottom Layer w0.254: v1(32.38,6.61) v1(32.38,4.71)
$1N28: length 36.8
  Top Layer w0.254: C5.2 41.91,40.33 41.91,30.36 49.58,22.69 49.58,20.38 49.4,20.2 46.61,20.2 45.34,18.93 43.27,18.93 U1.4
$1N30: length 1.9
  Top Layer w0.254: R5a.1 R5b.2
$1N73: length 27.5
  Top Layer w0.254: v1(37.47,45.86) 36.38,46.94 C4.2 ; v1(42.54,23.38) 42.54,22.2 U1.1
  Bottom Layer w0.254: v1(42.54,23.38) 42.54,40.78 v1(37.47,45.86)

## Text on the board
Top Silkscreen Layer: N-AI
